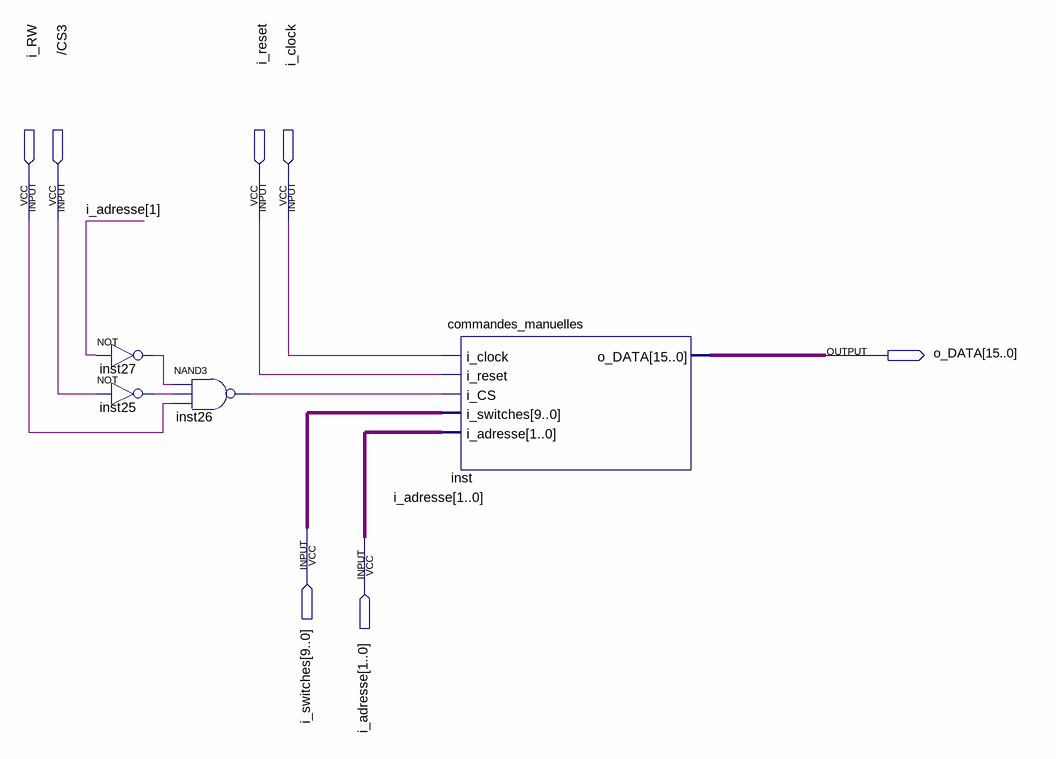
[diagram p0: schematic sheet]
// Quartus schematic SWITCHES_ROBOT.bdf as structural Verilog: 4 symbols, 7 pins
module SWITCHES_ROBOT (
  input  i_RW,
  input  \/CS3 ,
  input  i_reset,
  input  i_clock,
  input  [9:0] i_switches,
  input  [1:0] i_adresse,
  output [15:0] o_DATA
);

  wire inst25_out, inst26_out, inst27_out;

  not inst27 (inst27_out, i_adresse[1]);
  not inst25 (inst25_out, \/CS3 );
  nand inst26 (inst26_out, inst27_out, inst25_out, i_RW);
  commandes_manuelles inst (
    .i_clock(i_clock), .i_reset(i_reset), .i_CS(inst26_out), .i_switches(i_switches), .i_adresse(i_adresse),
    .o_DATA(o_DATA));
endmodule
